# Altium schematic sheet GNT604CPUR4.SchDoc
size B
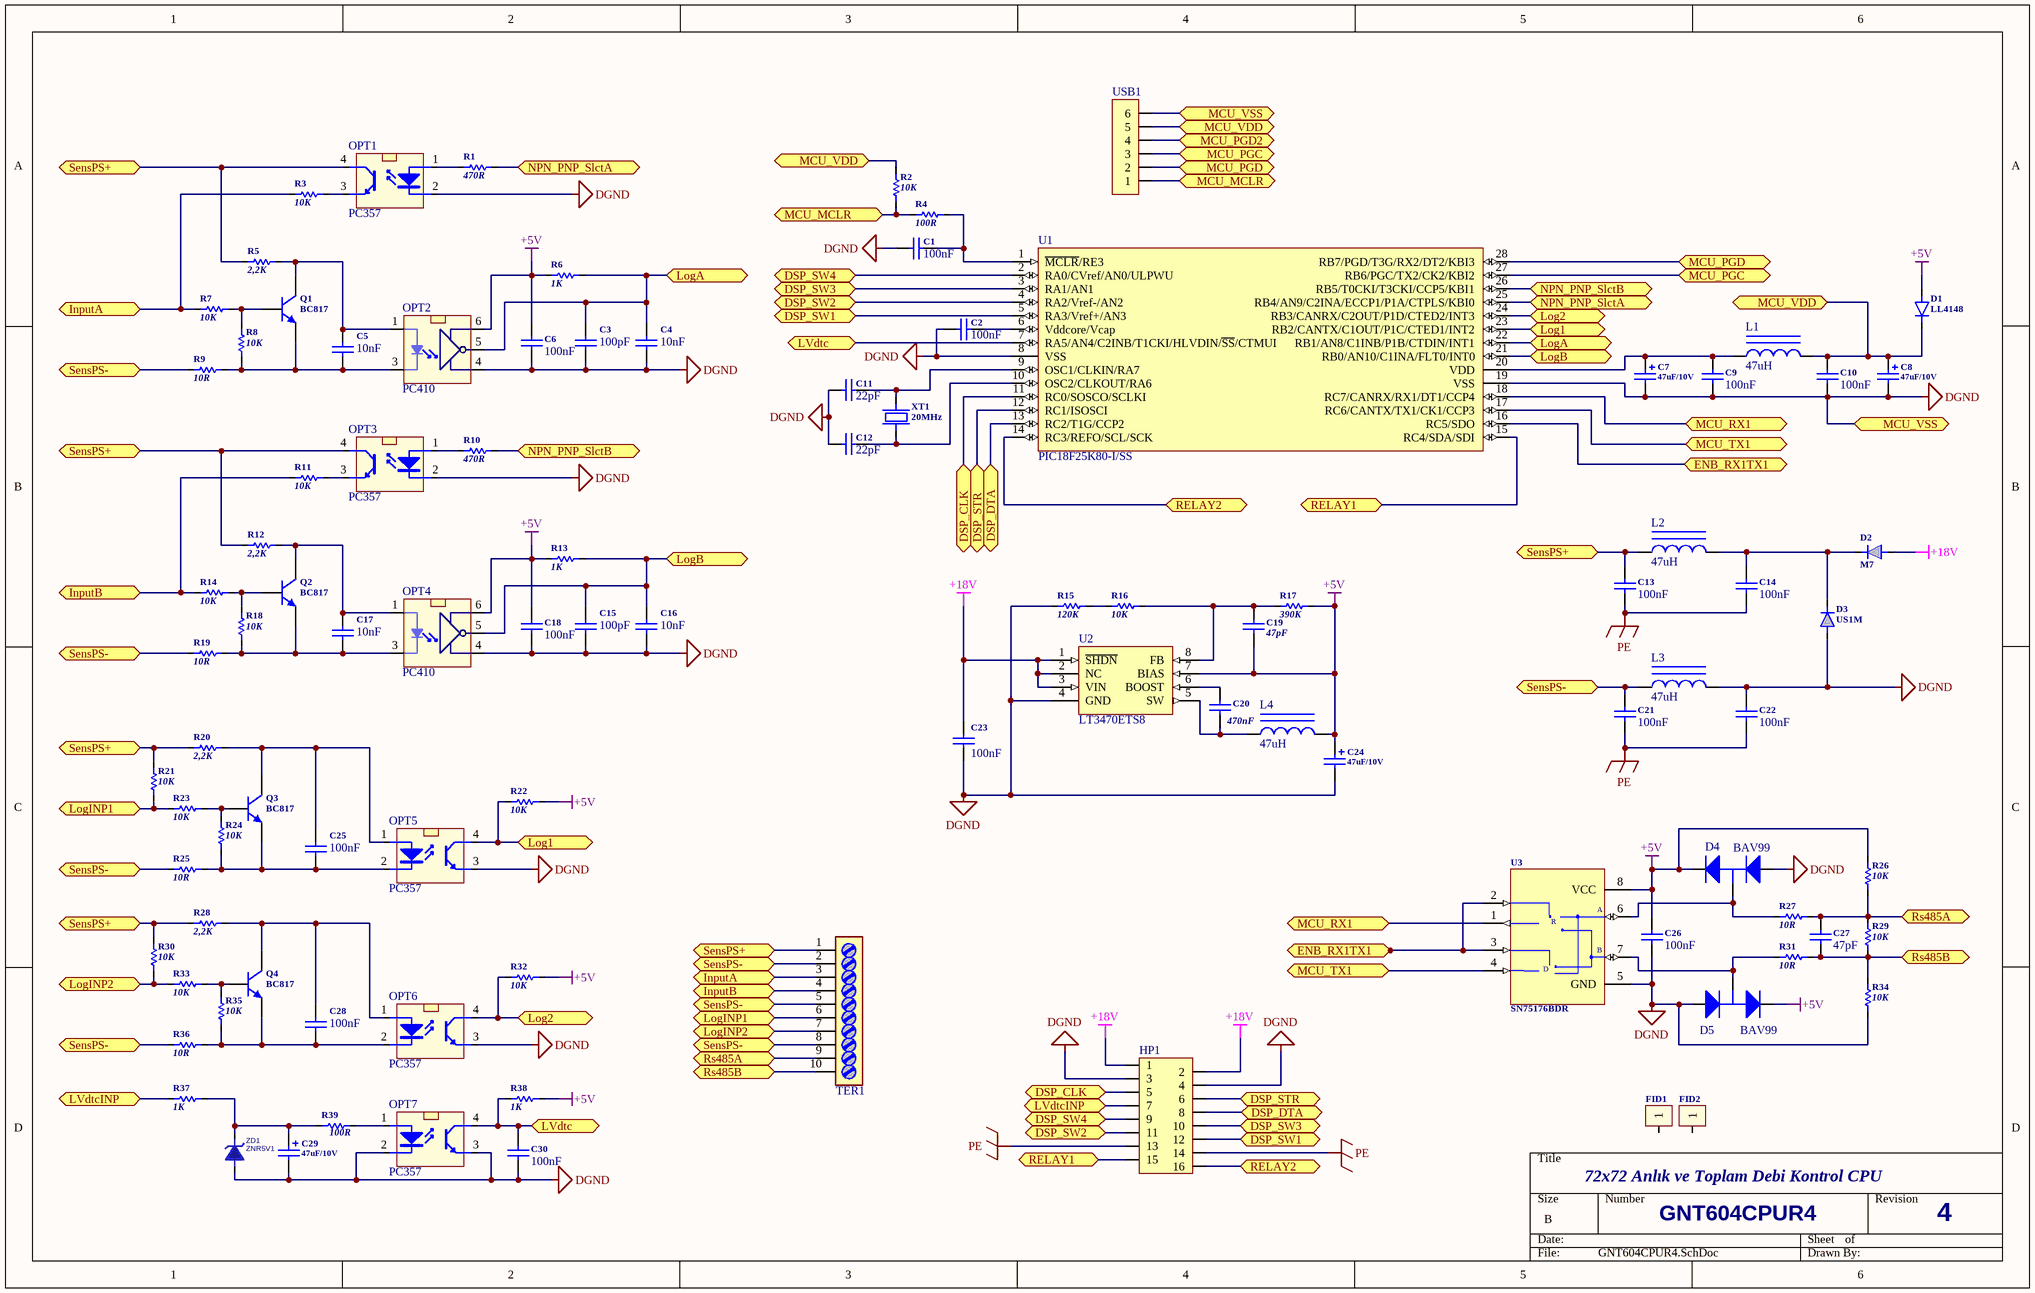
[diagram p0: GNT604CPUR4.SchDoc]

## Parts
C1  100nF  [CC0805]
C2  100nF  [CC0805]
C3  100pF  [CC0805]
C4  10nF  [CC0805]
C5  10nF  [CC0805]
C6  100nF  [CC0805]
C7  47uF/10V  [CAPSMDTANTAL-B]
C8  47uF/10V  [CAPSMDTANTAL-B]
C9  100nF  [CC0805]
C10  100nF  [CC0805]
C11  22pF  [CC0805]
C12  22pF  [CC0805]
C13  100nF  [CC0805]
C14  100nF  [CC0805]
C15  100pF  [CC0805]
C16  10nF  [CC0805]
C17  10nF  [CC0805]
C18  100nF  [CC0805]
C19  47pF  [CC0805]
C20  470nF  [CC0805]
C21  100nF  [CC0805]
C22  100nF  [CC0805]
C23  100nF  [CC0805]
C24  47uF/10V  [CAPSMDTANTAL-B]
C25  100nF  [CC0805]
C26  100nF  [CC0805]
C27  47pF  [CC0805]
C28  100nF  [CC0805]
C29  47uF/10V  [CAPSMDTANTAL-B]
C30  100nF  [CC0805]
D1  LL4148  [CD-SOD80]
D2  M7  [CD-SMA_DO214]
D3  US1M  [CD-SMA_DO214]
D4  BAV99  [SOT23_N]
D5  BAV99  [SOT23_N]
FID1  FIDUCIAL1  [FIDUCIAL1]  (value not drawn)
FID2  FIDUCIAL1  [FIDUCIAL1]  (value not drawn)
HP1  DS1015-05_CONFLY  [HeaderAntenk90Pin16]  (value not drawn)
L1  47uH  [INDC2.5X3.3]
L2  47uH  [INDC2.5X3.3]
L3  47uH  [INDC2.5X3.3]
L4  47uH  [INDC2.5X3.3]
OPT1  PC357  [SO-4]
OPT2  PC410  [SO-5]
OPT3  PC357  [SO-4]
OPT4  PC410  [SO-5]
OPT5  PC357  [SO-4]
OPT6  PC357  [SO-4]
OPT7  PC357  [SO-4]
Q1  BC817  [SOT23_N]
Q2  BC817  [SOT23_N]
Q3  BC817  [SOT23_N]
Q4  BC817  [SOT23_N]
R1  470R  [CR0805]
R2  10K  [CR0805]
R3  10K  [CR0805]
R4  100R  [CR0805]
R5  2,2K  [CR0805]
R6  1K  [CR0805]
R7  10K  [CR0805]
R8  10K  [CR0805]
R9  10R  [CR0805]
R10  470R  [CR0805]
R11  10K  [CR0805]
R12  2,2K  [CR0805]
R13  1K  [CR0805]
R14  10K  [CR0805]
R15  120K  [CR0805]
R16  10K  [CR0805]
R17  390K  [CR0805]
R18  10K  [CR0805]
R19  10R  [CR0805]
R20  2,2K  [CR0805]
R21  10K  [CR0805]
R22  10K  [CR0805]
R23  10K  [CR0805]
R24  10K  [CR0805]
R25  10R  [CR0805]
R26  10K  [CR0805]
R27  10R  [CR0805]
R28  2,2K  [CR0805]
R29  10K  [CR0805]
R30  10K  [CR0805]
R31  10R  [CR0805]
R32  10K  [CR0805]
R33  10K  [CR0805]
R34  10K  [CR0805]
R35  10K  [CR0805]
R36  10R  [CR0805]
R37  1K  [CR0805]
R38  1K  [CR0805]
R39  100R  [CR0805]
TER1  Terminal_H5.08x10  [Terminal_H5.08x10]  (value not drawn)
U1  PIC18F25K80-I/SS  [SSOP-SS28_N]
U2  LT3470ETS8  [TS8_N]
U3  SN75176BDR  [SO-8]
USB1  USB_MICRO  [MICRO_USB]  (value not drawn)
XT1  20MHz  [HC49/4H_SMX]
ZD1  ZNR5V1  [SOT23_N]

## Ports
DSP_CLK (bidir), DSP_DTA (bidir), DSP_STR (bidir), DSP_SW1 (bidir), DSP_SW2 (bidir), DSP_SW3 (bidir), DSP_SW4 (bidir), ENB_RX1TX1 (bidir), InputA (bidir), InputB (bidir), Log1 (bidir), Log2 (bidir), LogA (bidir), LogB (bidir), LogINP1 (bidir), LogINP2 (bidir), LVdtc (bidir), LVdtcINP (bidir), MCU_MCLR (bidir), MCU_PGC (bidir), MCU_PGD2 (bidir), MCU_PGD (bidir), MCU_RX1 (bidir), MCU_TX1 (bidir), MCU_VDD (bidir), MCU_VSS (bidir), NPN_PNP_SlctA (bidir), NPN_PNP_SlctB (bidir), RELAY1 (bidir), RELAY2 (bidir), Rs485A (bidir), Rs485B (bidir), SensPS+ (bidir), SensPS- (bidir)

## Nets
+5V: C6.1 C18.1 C19.2 C24.1(+) C26.1 D1.1(A) D4.2(K2) D5.2(K2) L4.2 OPT2.6 OPT4.6 R6.2 R13.2 R17.2 R22.2 R26.1 R32.2 R38.2 U2.7(BIAS) U3.8(VCC)
+18V: C23.2 D2.1(A) HP1.1 HP1.2 U2.1(~{SHDN}) U2.2(NC) U2.3(VIN)
DGND: C1.2 C2.2 C3.2 C4.2 C6.2 C7.2(-) C8.2(-) C9.1 C10.1 C11.2 C12.2 C15.2 C16.2 C18.2 C22.2 C23.1 C24.2(-) C26.2 C29.2(-) C30.2 D3.1(A) D4.1(A1) D5.1(A1) HP1.3 HP1.4 L3.2 OPT1.2(K) OPT2.4 OPT3.2(K) OPT4.4 OPT5.3(E) OPT6.3(E) OPT7.2(K) OPT7.3(E) R15.2 R34.2 U1.8(VSS) U1.19(VSS) U2.4(GND) U3.5(GND) USB1.6 ZD1.1(A) ; port MCU_VSS
PE: C13.1 C14.1 C21.1 C22.1 HP1.13 HP1.14
DSP_CLK: HP1.5 U1.11(RC0/SOSCO/SCLKI) ; port DSP_CLK
DSP_DTA: HP1.8 U1.13(RC2/T1G/CCP2) ; port DSP_DTA
DSP_STR: HP1.6 U1.12(RC1/ISOSCI) ; port DSP_STR
DSP_SW1: HP1.12 U1.5(RA3/Vref+/AN3) ; port DSP_SW1
DSP_SW2: HP1.11 U1.4(RA2/Vref-/AN2) ; port DSP_SW2
DSP_SW3: HP1.10 U1.3(RA1/AN1) ; port DSP_SW3
DSP_SW4: HP1.9 U1.2(RA0/CVref/AN0/ULPWU) ; port DSP_SW4
ENB_RX1TX1: U1.16(RC5/SDO) U3.2(~{RE}) U3.3(DE) ; port ENB_RX1TX1
InputA: R3.1 R7.2 TER1.3 ; port InputA
InputB: R11.1 R14.2 TER1.4 ; port InputB
Log1: OPT5.4(C) R22.1 U1.23(RB2/CANTX/C1OUT/P1C/CTED1/INT2) ; port Log1
Log2: OPT6.4(C) R32.1 U1.24(RB3/CANRX/C2OUT/P1D/CTED2/INT3) ; port Log2
LogA: C3.1 C4.1 OPT2.5 R6.1 U1.22(RB1/AN8/C1INB/P1B/CTDIN/INT1) ; port LogA
LogB: C15.1 C16.1 OPT4.5 R13.1 U1.21(RB0/AN10/C1INA/FLT0/INT0) ; port LogB
LogINP1: R21.2 R23.1 TER1.6 ; port LogINP1
LogINP2: R30.2 R33.1 TER1.7 ; port LogINP2
LVdtc: C30.1 OPT7.4(C) R38.1 U1.7(RA5/AN4/C2INB/T1CKI/HLVDIN/~{SS}/CTMUI) ; port LVdtc
LVdtcINP: HP1.7 R37.1 ; port LVdtcINP
MCU_MCLR: R2.2 R4.2 USB1.1 ; port MCU_MCLR
MCU_PGC: U1.27(RB6/PGC/TX2/CK2/KBI2) USB1.3 ; port MCU_PGC
MCU_PGD: U1.28(RB7/PGD/T3G/RX2/DT2/KBI3) USB1.2 ; port MCU_PGD
MCU_PGD2: USB1.4 ; port MCU_PGD2
MCU_RX1: U1.18(RC7/CANRX/RX1/DT1/CCP4) U3.1(RO) ; port MCU_RX1
MCU_TX1: U1.17(RC6/CANTX/TX1/CK1/CCP3) U3.4(DI) ; port MCU_TX1
MCU_VDD: C8.1(+) C10.2 D1.2(K) L1.2 R2.1 USB1.5 ; port MCU_VDD
NPN_PNP_SlctA: R1.1 U1.25(RB4/AN9/C2INA/ECCP1/P1A/CTPLS/KBI0) ; port NPN_PNP_SlctA
NPN_PNP_SlctB: R10.1 U1.26(RB5/T0CKI/T3CKI/CCP5/KBI1) ; port NPN_PNP_SlctB
RELAY1: HP1.15 U1.15(RC4/SDA/SDI) ; port RELAY1
RELAY2: HP1.16 U1.14(RC3/REFO/SCL/SCK) ; port RELAY2
Rs485A: C27.2 R26.2 R27.1 R29.1 TER1.9 ; port Rs485A
Rs485B: C27.1 R29.2 R31.1 R34.1 TER1.10 ; port Rs485B
SensPS+: C13.2 L2.1 OPT1.4(C) OPT3.4(C) R5.2 R12.2 R20.1 R21.1 R28.1 R30.1 TER1.1 ; port SensPS+
SensPS-: C21.2 L3.1 R9.2 R19.2 R25.2 R36.2 TER1.2 TER1.5 TER1.8 ; port SensPS-
NetC1_1: C1.1 R4.1 U1.1(~{MCLR}/RE3)
NetC2_1: C2.1 U1.6(Vddcore/Vcap)
NetC5_1: C5.1 OPT2.1 Q1.3(C) R5.1
NetC5_2: C5.2 OPT2.3 Q1.2(E) R8.2 R9.1
NetC7_1: C7.1(+) C9.2 L1.1 U1.20(VDD)
NetC11_1: C11.1 U1.9(OSC1/CLKIN/RA7) XT1.1
NetC12_1: C12.1 U1.10(OSC2/CLKOUT/RA6) XT1.2
NetC14_2: C14.2 D2.2(K) D3.2(K) L2.2
NetC17_1: C17.1 OPT4.1 Q2.3(C) R12.1
NetC17_2: C17.2 OPT4.3 Q2.2(E) R18.2 R19.1
NetC19_1: C19.1 R16.1 R17.1 U2.8(FB)
NetC20_1: C20.1 U2.6(BOOST)
NetC20_2: C20.2 L4.1 U2.5(SW)
NetC25_1: C25.1 OPT5.1(A) Q3.3(C) R20.2
NetC25_2: C25.2 OPT5.2(K) Q3.2(E) R24.2 R25.1
NetC28_1: C28.1 OPT6.1(A) Q4.3(C) R28.2
NetC28_2: C28.2 OPT6.2(K) Q4.2(E) R35.2 R36.1
NetC29_1: C29.1(+) R37.2 R39.1 ZD1.3(K)
NetD4_3: D4.3(AK) R27.2 U3.6(A)
NetD5_3: D5.3(AK) R31.2 U3.7(B)
NetOPT1_1: OPT1.1(A) R1.2
NetOPT1_3: OPT1.3(E) R3.2
NetOPT3_1: OPT3.1(A) R10.2
NetOPT3_3: OPT3.3(E) R11.2
NetOPT7_1: OPT7.1(A) R39.2
NetQ1_1: Q1.1(B) R7.1 R8.1
NetQ2_1: Q2.1(B) R14.1 R18.1
NetQ3_1: Q3.1(B) R23.2 R24.1
NetQ4_1: Q4.1(B) R33.2 R35.1
NetR15_1: R15.1 R16.2

Not connected (* = marked no-connect by the designer): FID1 1; FID2 1

## Notes on the sheet
- 72x72 Anlık ve Toplam Debi Kontrol CPU
- GNT604CPUR4
- 4
- (in symbol SN75176BDR) R; D

## Library data of the parts
C1-C6 C9-C18 C21-C23 C25-C28 C30 = CC-0805: Ceramic Chip Capacitor - Standard
C7 C8 C24 C29 = CAPSMDTANTAL-B: CA45 Chip Tantalum Capacitors; Published: *; Publisher: *; Manufacturer: *; Class: *; SubClass: *
C19 C20 = CC-0805: Ceramic Chip Capacitor - Standard; Note: Footprint corresponds to dimensions for bulk cassette packaging. This case size has tightened tolerances.; Value: 100nF; Published: 17-Jul-2002; LatestRevisionDate: 19-Mar-2004; LatestRevisionNote: Silkscreen size reduced.; DatasheetDocument: Mar-2001; PackageDocument: Mar-2001; PackageReference: 0805; Publisher: Altium Limited; Code_JEITA: 0805; Code_IPC: 2012[0805]; ComponentLink1Description: Manufacturer Link; ComponentLink1URL: http://www.kemet.com/; ComponentLink2Description: Datasheet; ComponentLink2URL: http://www.kemet.com/kemet/web/homepage/kechome.nsf/vapubfilesname/F3102TA.pdf/$file/F3102TA.pdf
D1 = CD-SOD80: ChipDiode-MiniMELF-SOD80
D2 = CD-SMA_DO214: ChipDiodeSMA
D3 = US1M: ChipDiodeSMA, ultra fast diode
D4 D5 = BAV99: Ultrafast, Soft Recovery Diode
HP1 = Header Antenk90PinF16: Header, 16-Pin, 90 DEGREES; Revision: 17-Jul-2002: Re-released for DXP Platform.; Publisher: Altium Limited
L1-L4 = Inductor Iron_47uH: Magnetic-Core Inductor_SMD; Published: 24-Mar-1999; Revision: July-2002: Re-released for DXP Platform.; Publisher: Altium Limited
OPT1 OPT3 OPT5-OPT7 = PC357: Optoisolator
OPT2 OPT4 = PC410: Ultra-high Speed Response  OPIC Photocoupler
Q1-Q4 = BC817-40: NPN General Purpose Amplifier; Text Field7: Published 29-Sep-2000
R1-R39 = CR-0805: ChipResistor0805; Published: 8-Jun-2000; LatestRevisionDate: 17-Jul-2002; LatestRevisionNote: Re-released for DXP Platform.; PackageReference: AXIAL-0.3; Publisher: Altium Limited
TER1 = Terminal_H5.08x10: Terminal Block Horizontal 5.08mm 10 pin
U1 = PIC18F25K80-I/SS: Flash Microcontroller with 10-Bit A/D and nanoWatt Technology, 32K Flash, 28-Pin SSOP, Industrial Temperature Range, Tape and Reel; FirstPublished: 29-Jan-2009; LatestRevisionDate: 02-Dec-2009; LatestRevisionNote: Updated to datasheet revision F, Sep-2009; DatasheetVersion: revF, Sep-2009; PackageVersion: revBB, Aug-2009; PackageReference: SSOP-SS28; Publisher: Altium Limited; PackageDescription: 28-Lead Plastic Shrink Small Outline (SS) - 5.3mm Body [SSOP]; Supplier 1: Digi-Key; Supplier Part Number 1: PIC18F25K20T-I/SSTR-ND; Supplier 2: Digi-Key; Supplier Part Number 2: PIC18F25K20T-I/SSCT-ND; Supplier 3: Digi-Key; Supplier Part Number 3: PIC18F25K20T-I/SSDKR-ND; Supplier 4: Newark; Supplier Part Number 4: 88K5991; Code_JEDEC: MS-150; Code_IPC: SOP65P780-28; ComponentLink1Description: Datasheet; ComponentLink1URL: http://ww1.microchip.com/downloads/en/DeviceDoc/41303F.pdf; ComponentLink2Description: Packaging Specification; ComponentLink2URL: http://www.microchip.com/stellent/groups/techpub_sg/documents/packagingspec/en012702.pdf; ComponentLink3Description: Microchip.com Home; ComponentLink3URL: http://www.microchip.com/
U2 = LT3470ETS8: 200mA, Micropower Buck Regulator; Note: 1916; Published: 30-May-2008; DatasheetVersion: Aug-2007; PackageVersion: revA, 2000; PackageReference: MS8; Publisher: Altium Limited; PackageDescription: 8-Pin Thin Small Outline Package 0.65 mm Pitch; ComponentLink1Description: Manufacturer Link; ComponentLink1URL: http://www.linear.com/; ComponentLink2Description: Datasheet; ComponentLink2URL: http://www.linear.com/pc/downloadDocument.do?navId=H0,C1,C1003,C1040,C1055,P1378,D3343
U3 = SN75176BDR: Low-Power,RS-485/RS-422 Transceiver; PackageDocument: RevB, 21-0043; Published: 16-Jan-2001; LatestRevisionDate: 6-Jun-2005; LatestRevisionNote: Stylized 3D Model Added.; DatasheetDocument: Feb-1996; PackageReference: PA8; Publisher: Altium Limited; Code_JEDEC: MS-001-AB; ComponentLink1Description: Manufacturer Link; ComponentLink1URL: http://www.maxim-ic.com/; ComponentLink2Description: Datasheet; ComponentLink2URL: http://pdfserv.maxim-ic.com/en/ds/MAX1487-MAX491.pdf
USB1 = USB_MICRO: Connector; USB2.0, Type A, SM; 5 Position; Right Angle; Revision: 17-Jul-2002: Re-released for DXP Platform.; Publisher: Altium Limited
XT1 = XTALL_SMD: HS-XTALL(SMD)
ZD1 = ZENER2-SOT23: Zener Diode